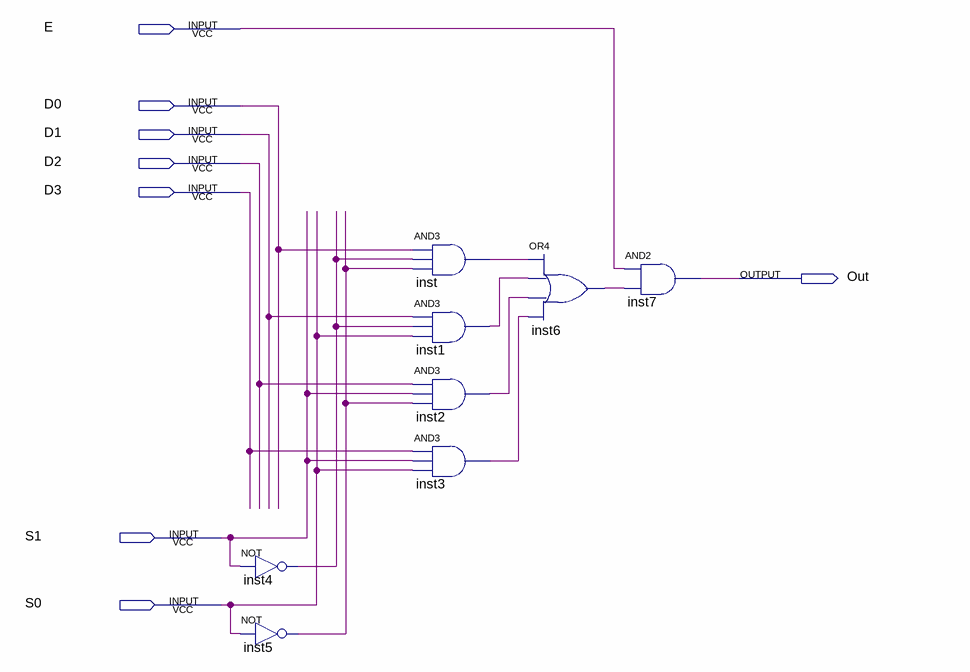
[diagram p0: schematic sheet]
// Quartus schematic FourOneMUX.bdf as structural Verilog: 8 symbols, 8 pins
module FourOneMUX (
  input  E,
  input  D0,
  input  D1,
  input  D2,
  input  D3,
  input  S1,
  input  S0,
  output Out
);

  wire inst1_out, inst2_out, inst3_out, inst4_out, inst5_out, inst6_out, inst_out;

  not inst4 (inst4_out, S1);
  not inst5 (inst5_out, S0);
  and inst (inst_out, D0, inst4_out, inst5_out);
  and inst1 (inst1_out, D1, inst4_out, S0);
  and inst2 (inst2_out, D2, S1, inst5_out);
  and inst3 (inst3_out, D3, S1, S0);
  or inst6 (inst6_out, inst_out, inst1_out, inst2_out, inst3_out);
  and inst7 (Out, E, inst6_out);
endmodule
